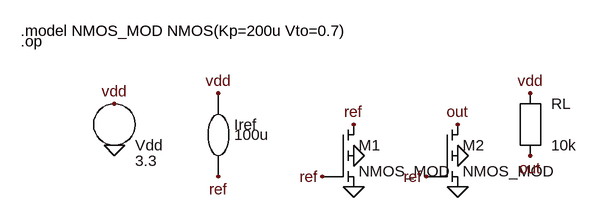
[diagram p0: schematic nmos_mirror_labelled.asc]
nmos_mirror_labelled.asc, the LTspice schematic file:
Version 4
SHEET 1 880 680
FLAG 160 128 vdd
FLAG 160 192 0
FLAG 320 112 vdd
FLAG 320 240 ref
FLAG 528 160 ref
FLAG 480 240 ref
FLAG 528 256 0
FLAG 528 208 0
FLAG 688 160 out
FLAG 640 240 ref
FLAG 688 256 0
FLAG 688 208 0
FLAG 800 112 vdd
FLAG 800 208 out
SYMBOL voltage 160 160 R0
SYMATTR InstName Vdd
SYMATTR Value 3.3
SYMBOL current 320 160 R0
SYMATTR InstName Iref
SYMATTR Value 100u
SYMBOL nmos4 480 160 R0
SYMATTR InstName M1
SYMATTR Value NMOS_MOD
SYMBOL nmos4 640 160 R0
SYMATTR InstName M2
SYMATTR Value NMOS_MOD
SYMBOL res 800 160 R0
SYMATTR InstName RL
SYMATTR Value 10k
TEXT 16 16 Left 2 !.model NMOS_MOD NMOS(Kp=200u Vto=0.7)
TEXT 16 32 Left 2 !.op

The netlist it stands for:
* nmos_mirror_labelled.asc
Vdd vdd 0 3.3
Iref vdd ref 100u
M1 ref ref 0 0 NMOS_MOD
M2 out ref 0 0 NMOS_MOD
RL vdd out 10k
.model NMOS NMOS
.model PMOS PMOS
.lib standard.mos
.model NMOS_MOD NMOS(Kp=200u Vto=0.7)
.op
.backanno
.end